# Altium project DA-12_MB.PrjPcb (part 1 of 4)
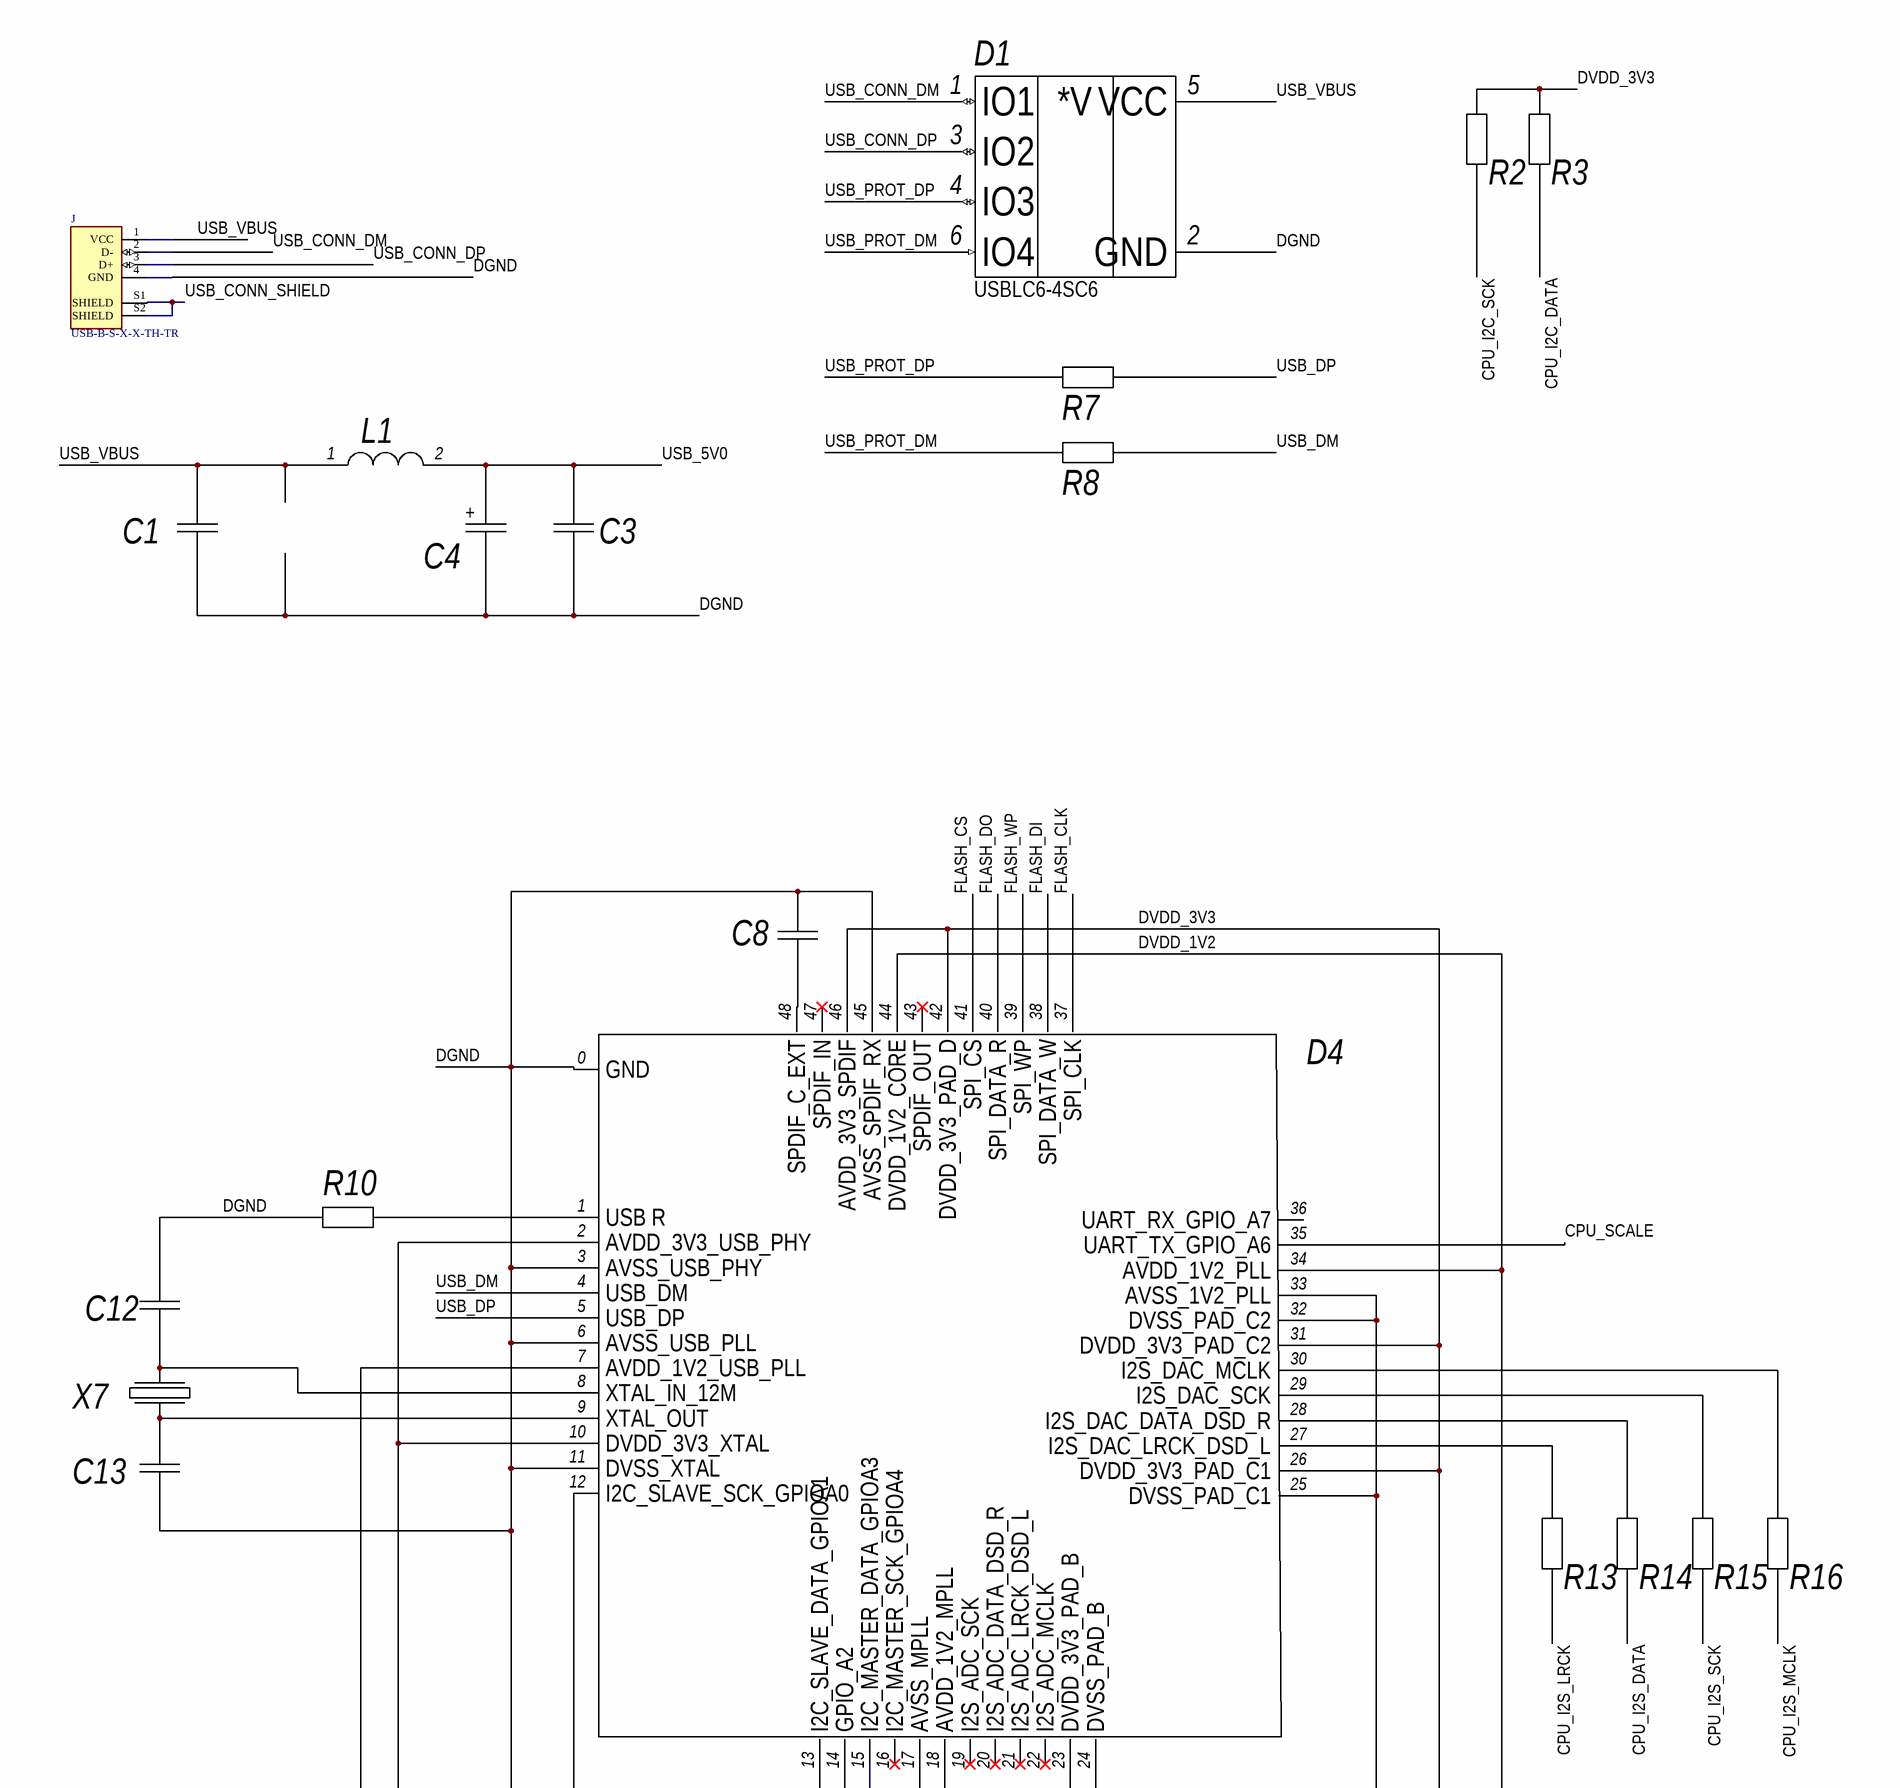
[diagram p0: da12-mb.SchDoc, top left]
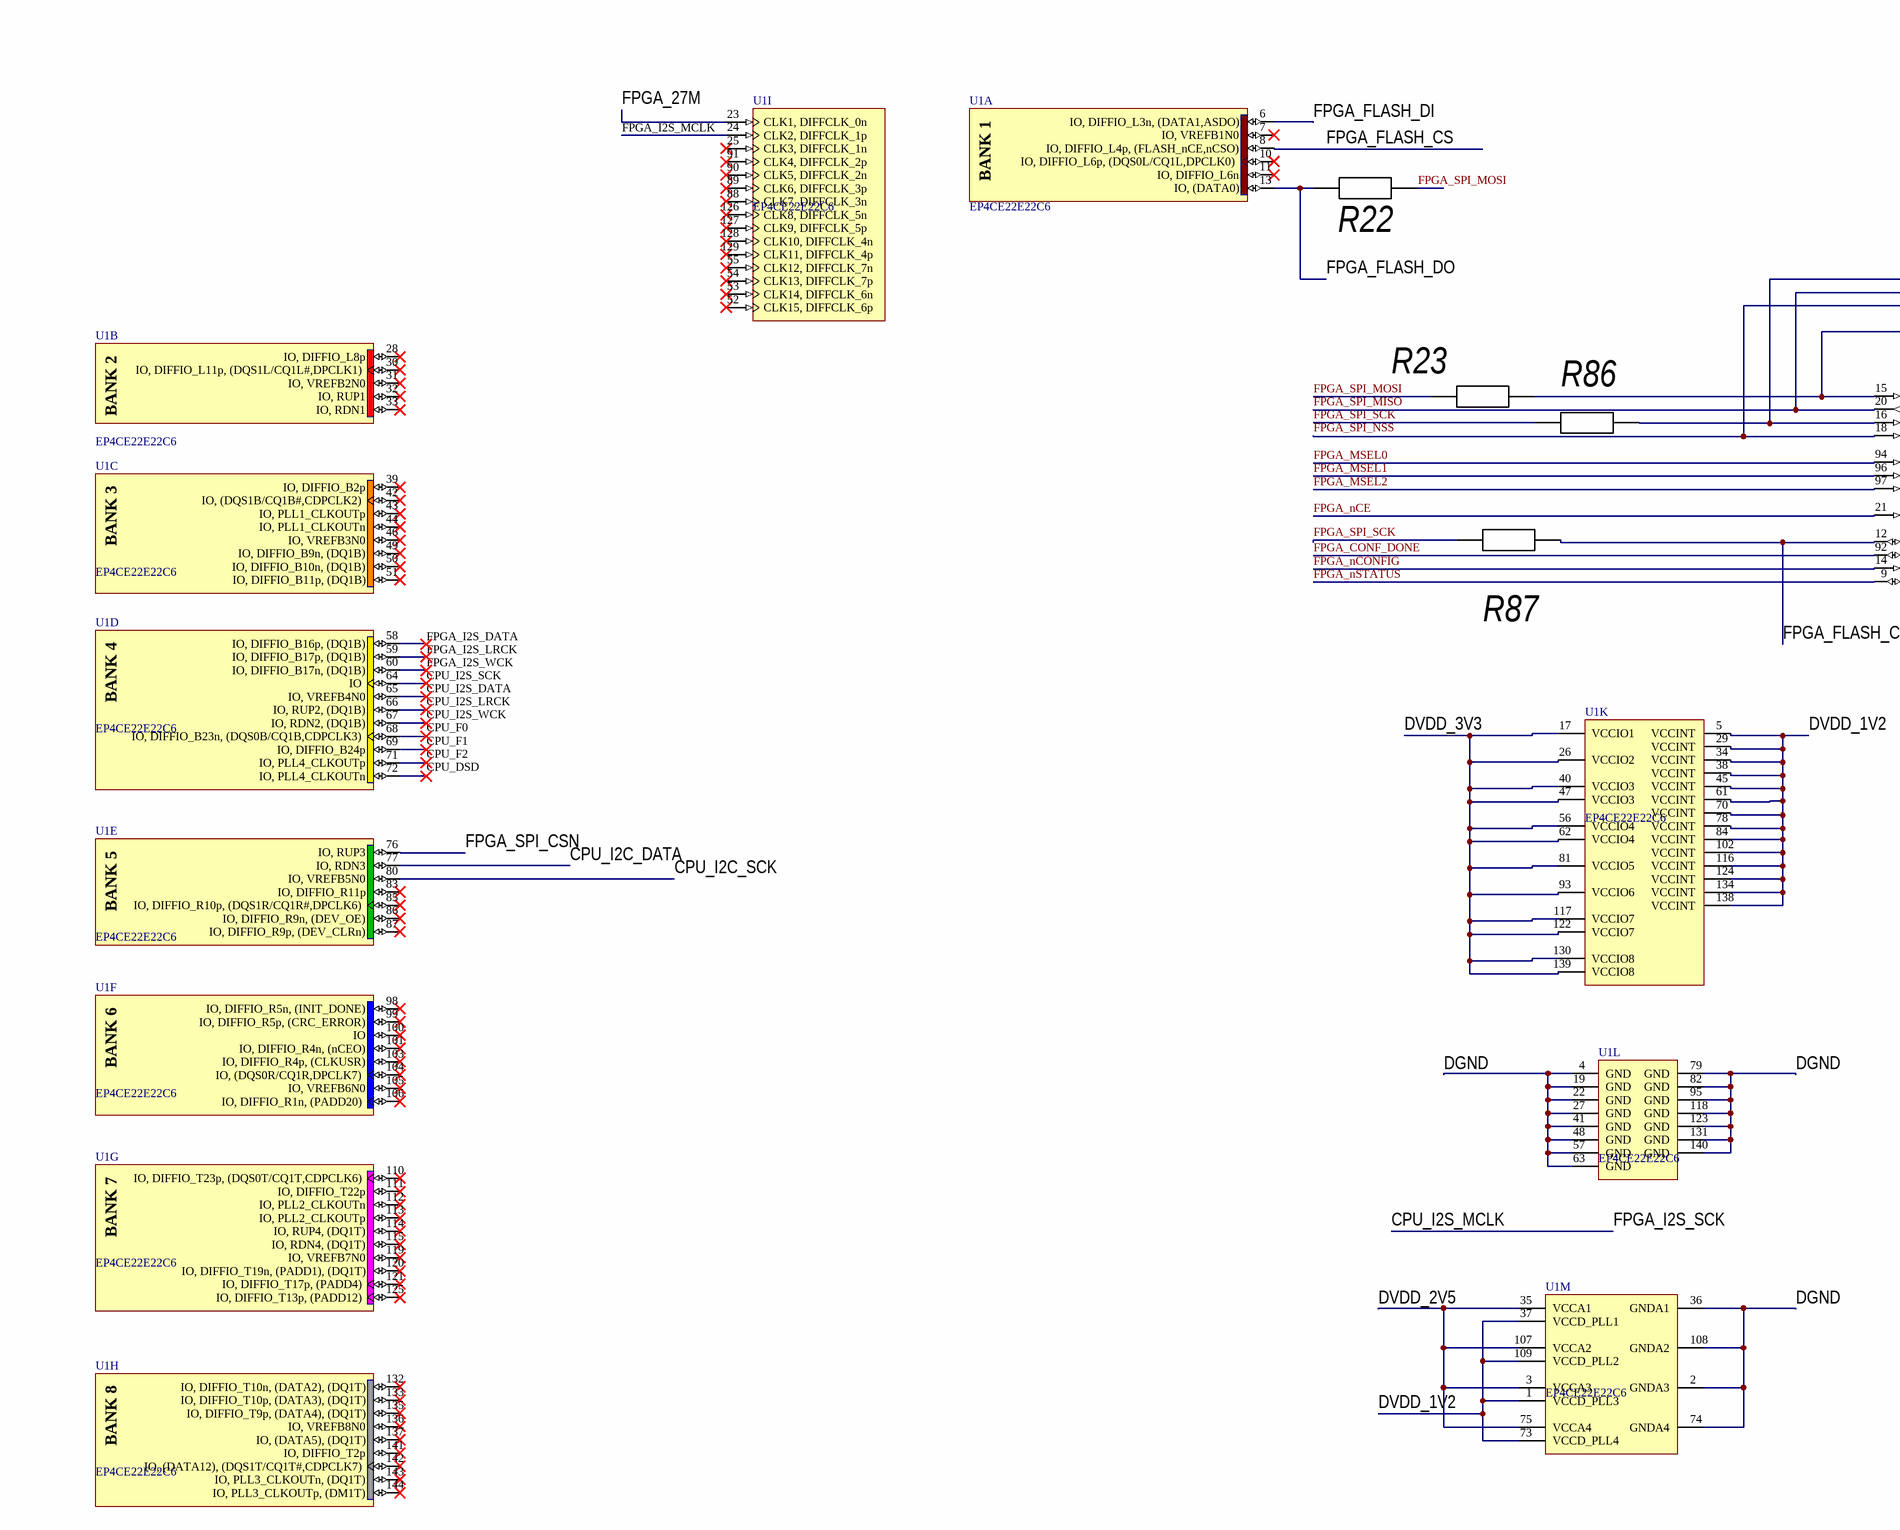
[diagram p1: da12-mb.SchDoc, top middle]
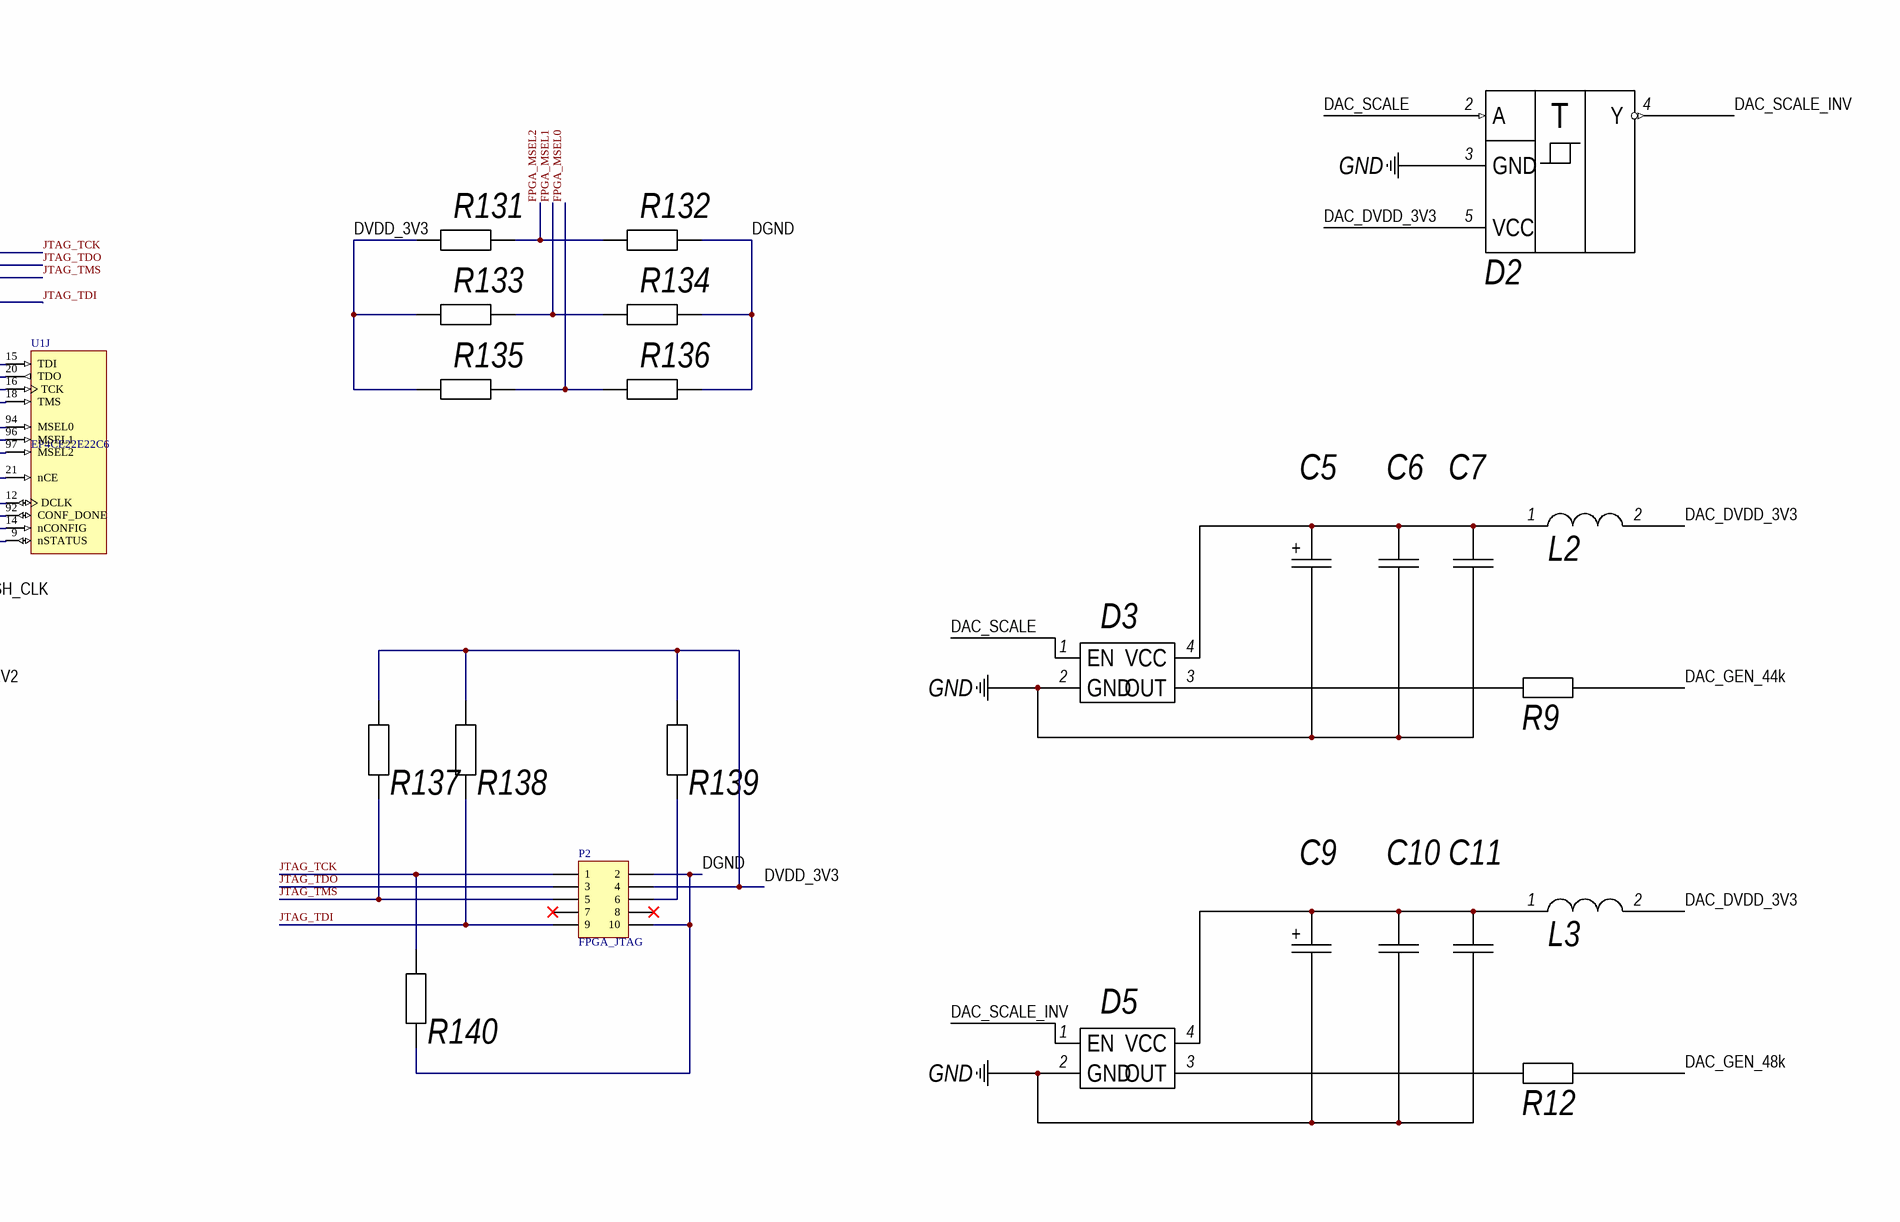
[diagram p2: da12-mb.SchDoc, top right]
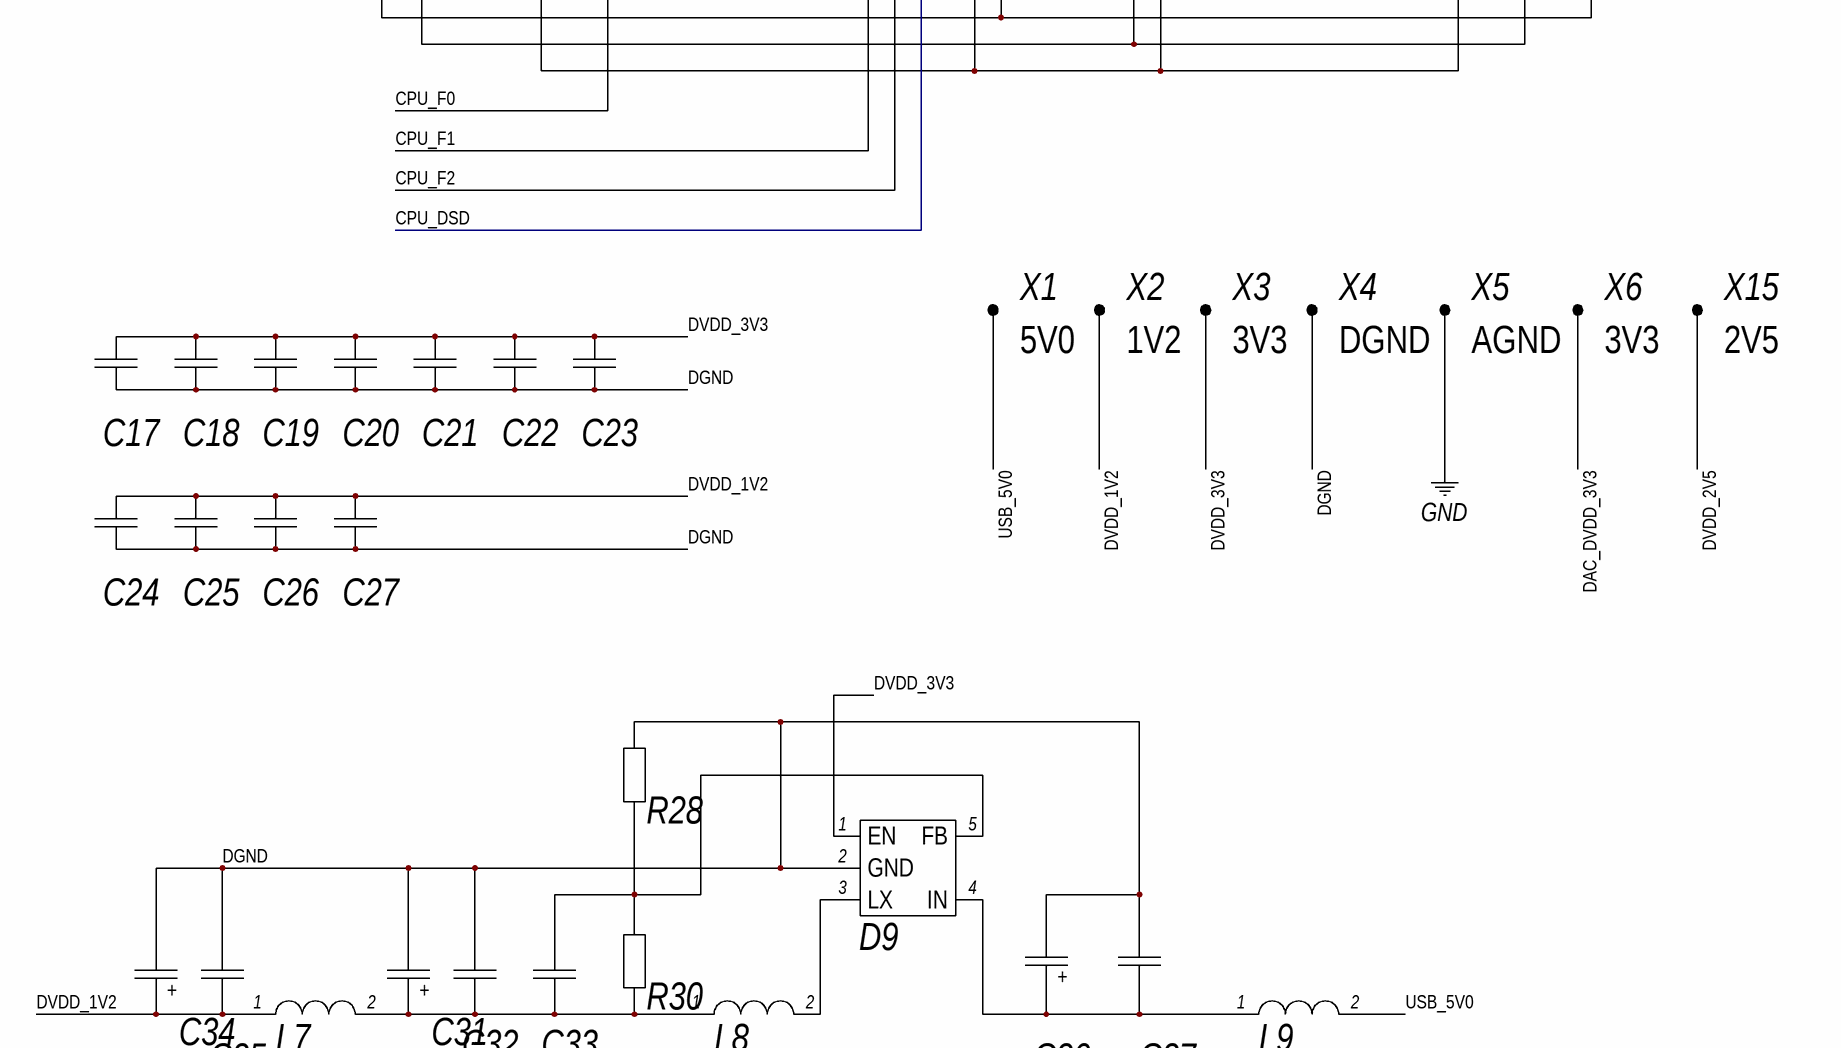
[diagram p3: da12-mb.SchDoc, centre left]
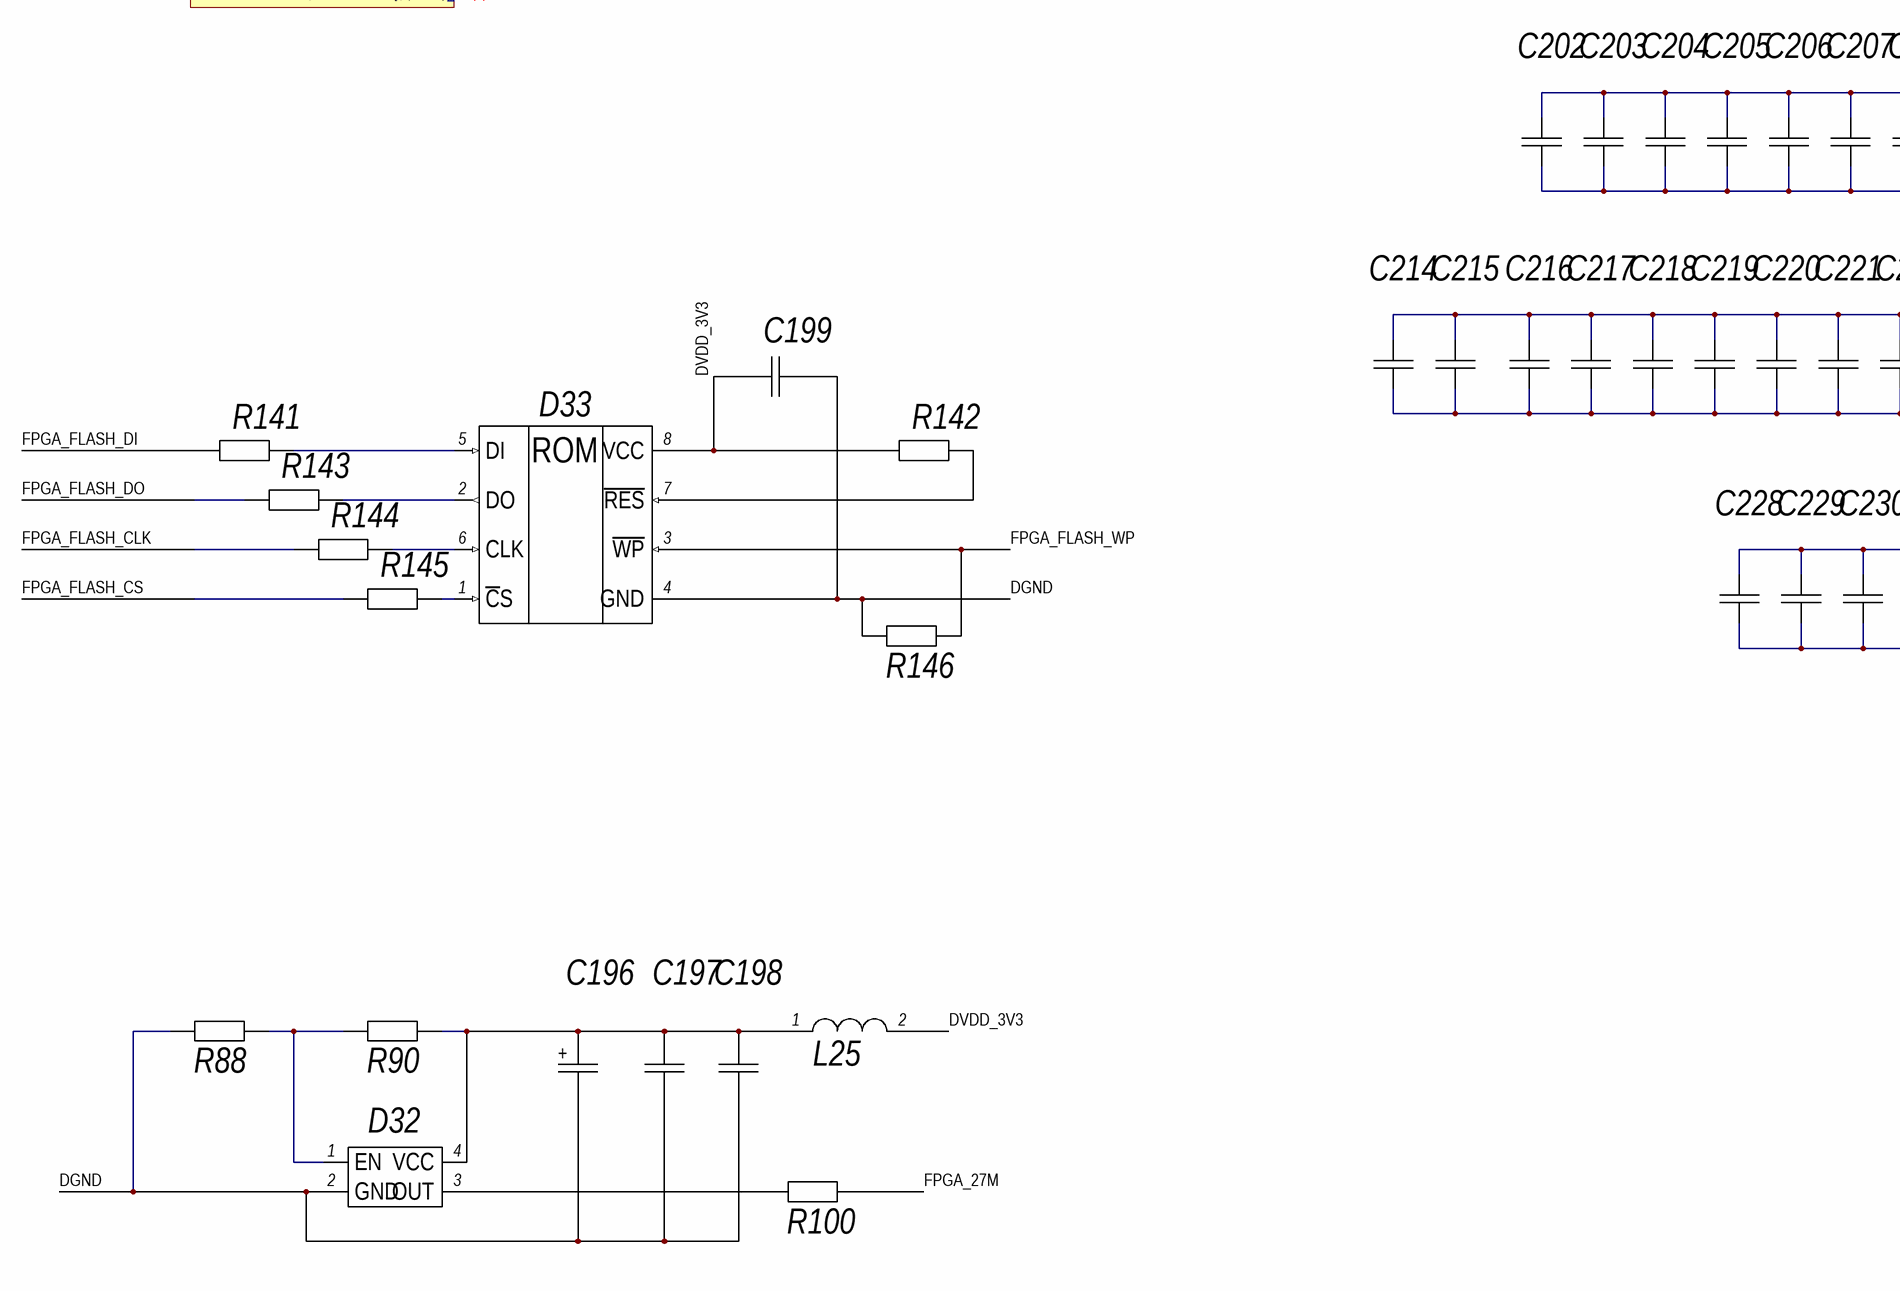
[diagram p4: da12-mb.SchDoc, centre middle]
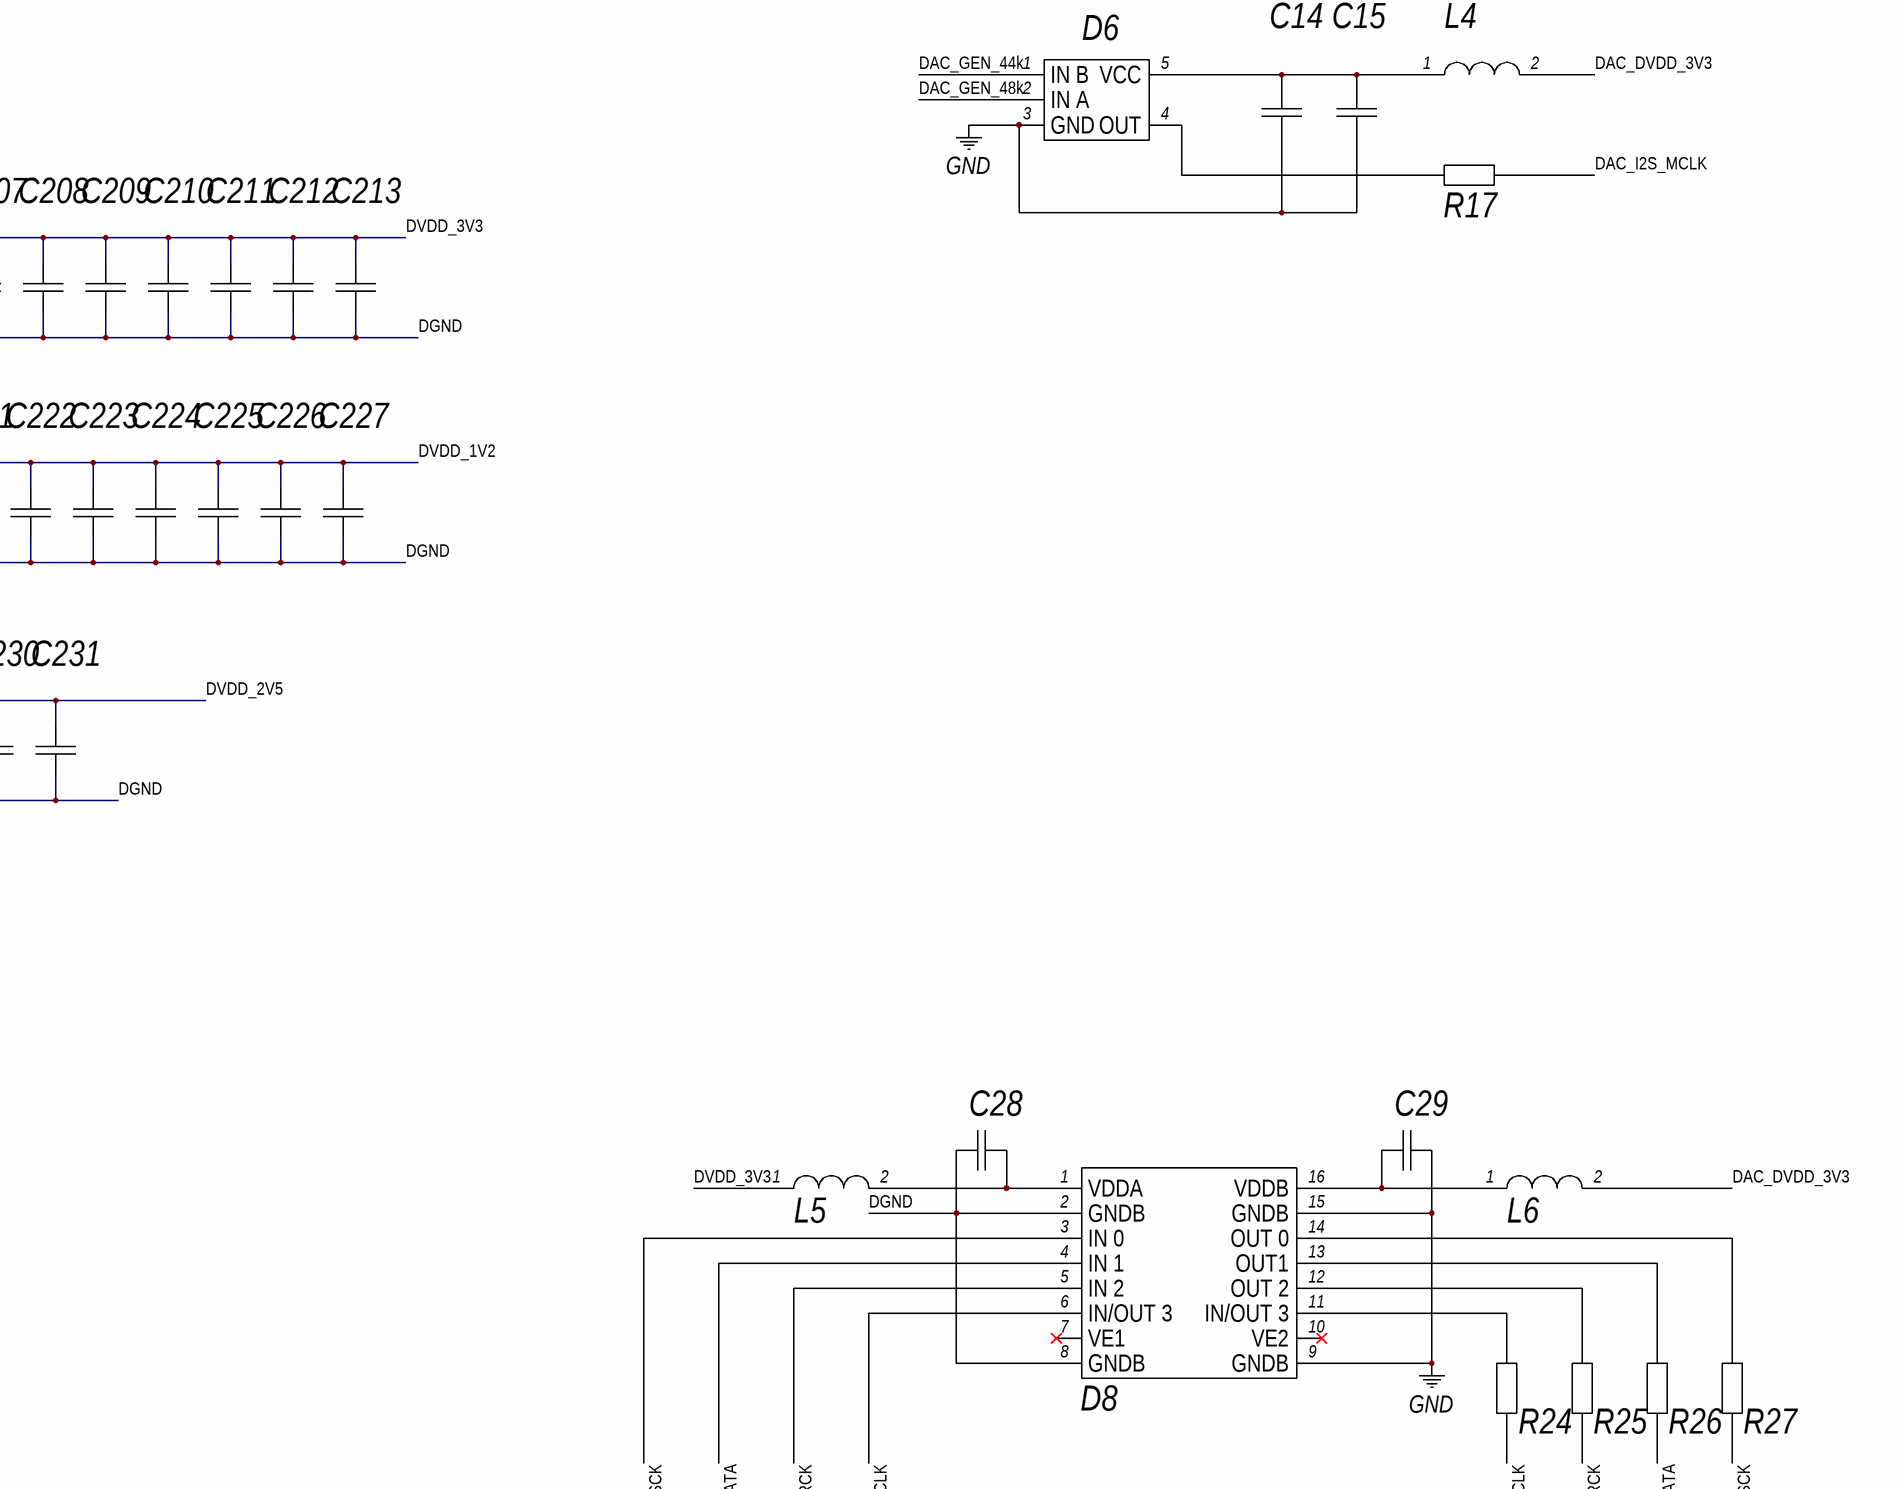
[diagram p5: da12-mb.SchDoc, centre right]
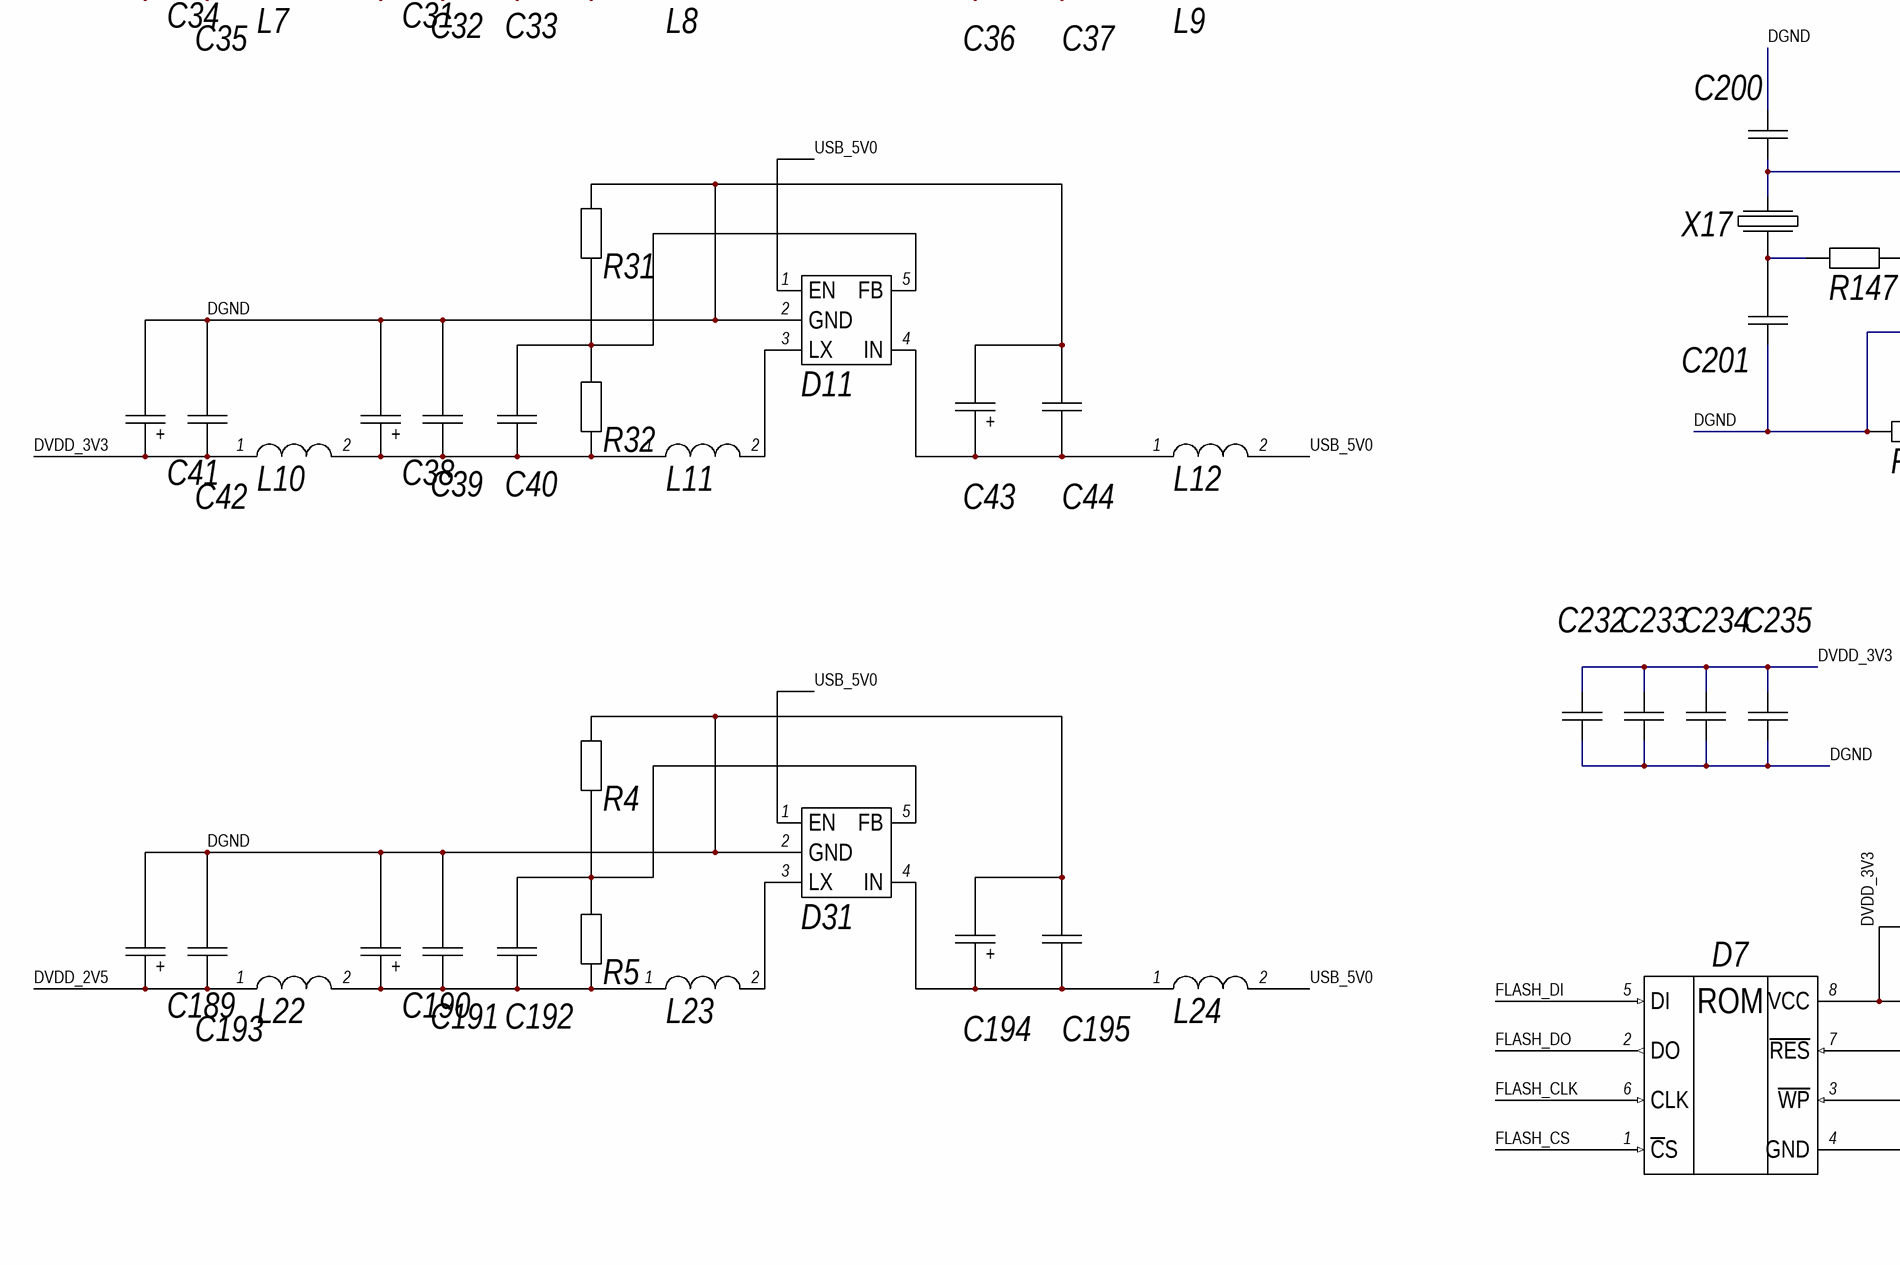
[diagram p6: da12-mb.SchDoc, bottom left]
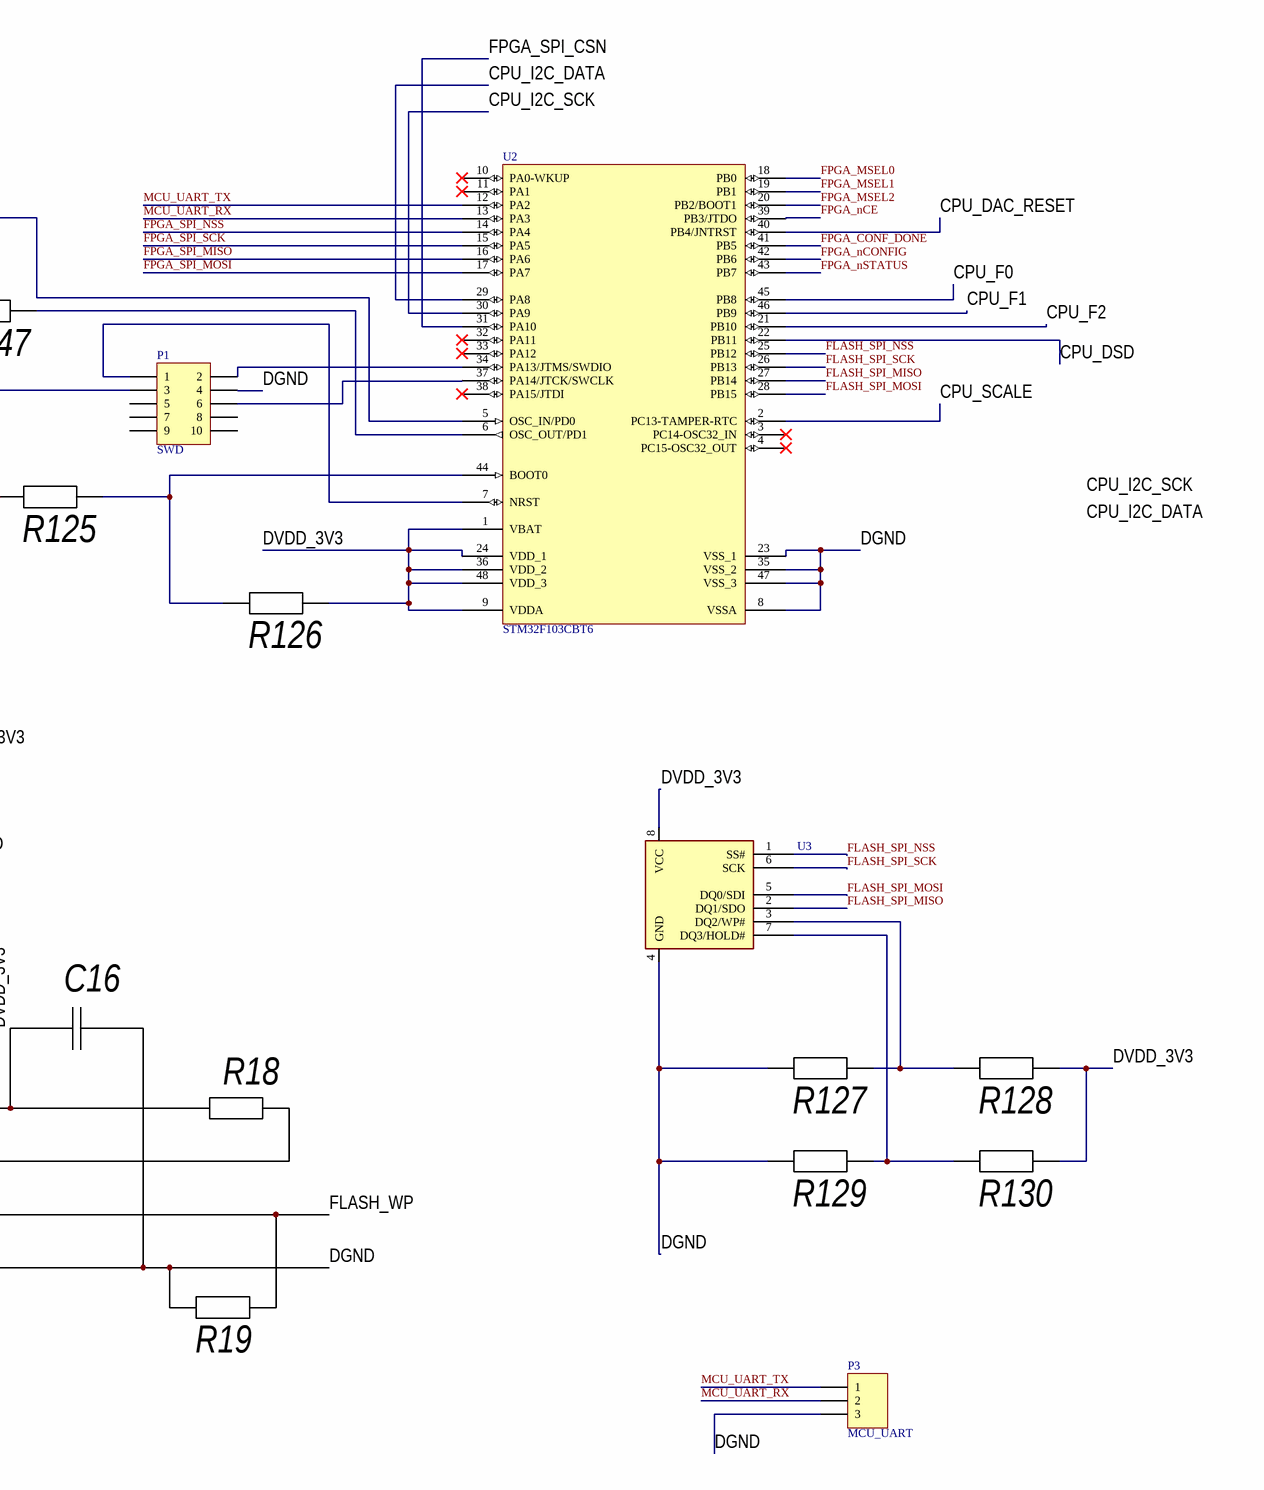
[diagram p7: da12-mb.SchDoc, bottom middle]
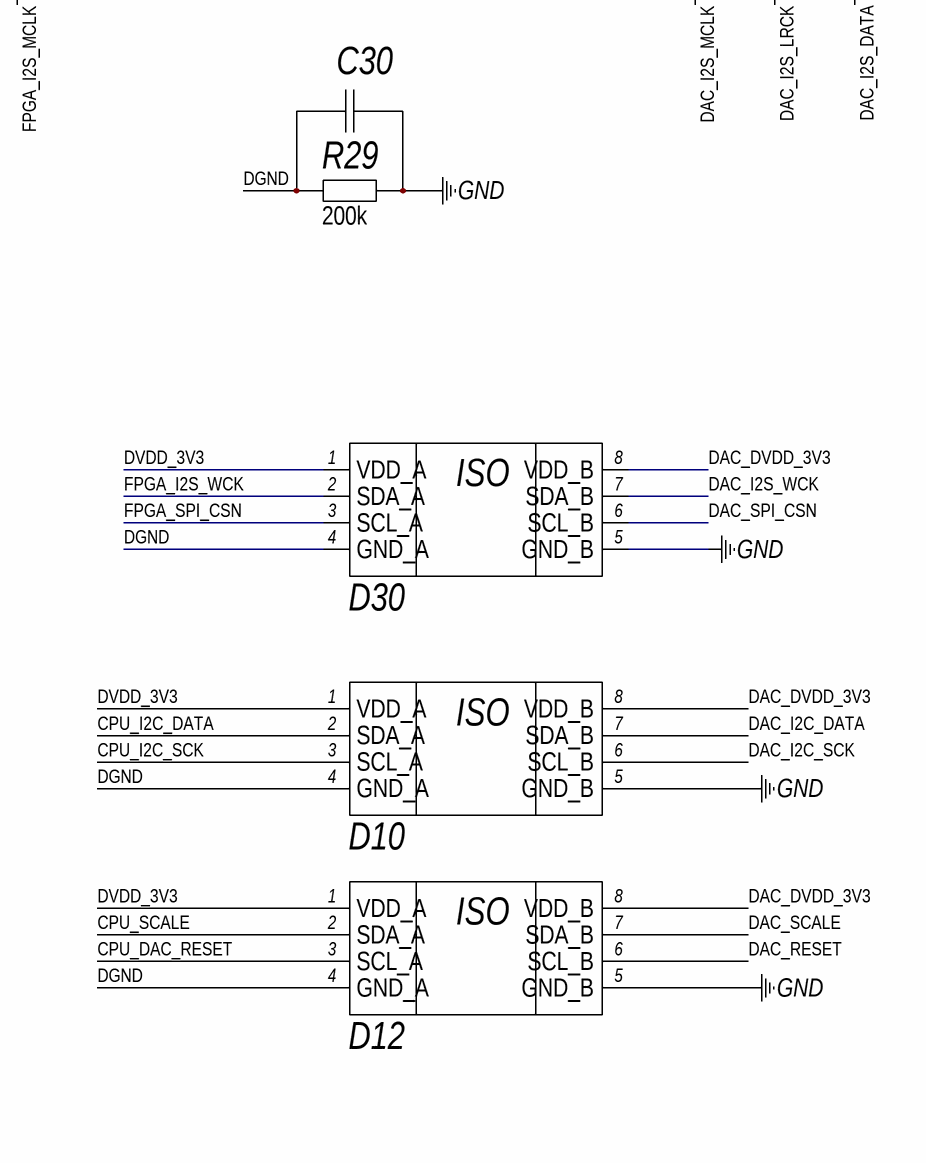
[diagram p8: da12-mb.SchDoc, bottom right]
3 sheets, 473 parts. Net scope: global (net labels, ports and power ports of the same name join across sheets).
Board files: da12_v100.PcbDoc, DA13_FPGA_edition.PcbDoc
Sheets:
  da12-mb.SchDoc
  DAC_4493.SchDoc
  ha.SchDoc

## Sheet da12-mb.SchDoc
size 1188 x 840 mm; SheetNumber: 1; SheetTotal: 3

### Parts
C1  CC0805MRX7R9BB104  [CAPC200X125X95L50N]  (value not drawn)
C3  CC0805MRX7R9BB104  [CAPC200X125X95L50N]  (value not drawn)
C4  EEEFK1A102AP  [CAPAE1030X1050L320X90N]  (value not drawn)
C5  Обозначение при заказе  [TANT_B]  (value not drawn)
C6  CC0805JRNPO9BN160  [CAPC200X125X95L50N]  (value not drawn)
C7  CC0805MRX7R9BB104  [CAPC200X125X95L50N]  (value not drawn)
C8  CC0805MRX7R9BB104  [CAPC200X125X95L50N]  (value not drawn)
C9  Обозначение при заказе  [TANT_B]  (value not drawn)
C10  CC0805JRNPO9BN160  [CAPC200X125X95L50N]  (value not drawn)
C11  CC0805MRX7R9BB104  [CAPC200X125X95L50N]  (value not drawn)
C12  CC0805JRNPO7BN220  [CAPC200X125X95L50N]  (value not drawn)
C13  CC0805JRNPO7BN220  [CAPC200X125X95L50N]  (value not drawn)
C14  CC0805JRNPO9BN160  [CAPC200X125X95L50N]  (value not drawn)
C15  CC0805MRX7R9BB104  [CAPC200X125X95L50N]  (value not drawn)
C16  CC0805MRX7R9BB104  [CAPC200X125X95L50N]  (value not drawn)
C17  CC0805MRX7R9BB104  [CAPC200X125X95L50N]  (value not drawn)
C18  CC0805MRX7R9BB104  [CAPC200X125X95L50N]  (value not drawn)
C19  CC0805MRX7R9BB104  [CAPC200X125X95L50N]  (value not drawn)
C20  CC0805MRX7R9BB104  [CAPC200X125X95L50N]  (value not drawn)
C21  CC0805MRX7R9BB104  [CAPC200X125X95L50N]  (value not drawn)
C22  CC0805MRX7R9BB104  [CAPC200X125X95L50N]  (value not drawn)
C23  CC0805MRX7R9BB104  [CAPC200X125X95L50N]  (value not drawn)
C24  CC0805MRX7R9BB104  [CAPC200X125X95L50N]  (value not drawn)
C25  CC0805MRX7R9BB104  [CAPC200X125X95L50N]  (value not drawn)
C26  CC0805MRX7R9BB104  [CAPC200X125X95L50N]  (value not drawn)
C27  CC0805MRX7R9BB104  [CAPC200X125X95L50N]  (value not drawn)
C28  CC0805MRX7R9BB104  [CAPC200X125X95L50N]  (value not drawn)
C29  CC0805MRX7R9BB104  [CAPC200X125X95L50N]  (value not drawn)
C30  GRM31CR71A226KE15L  [CAPC320X160X180L55]  (value not drawn)
C31  Обозначение при заказе  [TANT_B]  (value not drawn)
C32  CC0805MRX7R9BB104  [CAPC200X125X95L50N]  (value not drawn)
C33  CC0805MRX7R9BB101  [CAPC200X125X95L50N]  (value not drawn)
C34  Обозначение при заказе  [TANT_B]  (value not drawn)
C35  CC0805MRX7R9BB104  [CAPC200X125X95L50N]  (value not drawn)
C36  Обозначение при заказе  [TANT_B]  (value not drawn)
C37  CC0805MRX7R9BB104  [CAPC200X125X95L50N]  (value not drawn)
C38  Обозначение при заказе  [TANT_B]  (value not drawn)
C39  CC0805MRX7R9BB104  [CAPC200X125X95L50N]  (value not drawn)
C40  CC0805MRX7R9BB101  [CAPC200X125X95L50N]  (value not drawn)
C41  Обозначение при заказе  [TANT_B]  (value not drawn)
C42  CC0805MRX7R9BB104  [CAPC200X125X95L50N]  (value not drawn)
C43  Обозначение при заказе  [TANT_B]  (value not drawn)
C44  CC0805MRX7R9BB104  [CAPC200X125X95L50N]  (value not drawn)
C189  Обозначение при заказе  [TANT_B]  (value not drawn)
C190  Обозначение при заказе  [TANT_B]  (value not drawn)
C191  CC0805MRX7R9BB104  [CAPC200X125X95L50N]  (value not drawn)
C192  CC0805MRX7R9BB101  [CAPC200X125X95L50N]  (value not drawn)
C193  CC0805MRX7R9BB104  [CAPC200X125X95L50N]  (value not drawn)
C194  Обозначение при заказе  [TANT_B]  (value not drawn)
C195  CC0805MRX7R9BB104  [CAPC200X125X95L50N]  (value not drawn)
C196  Обозначение при заказе  [TANT_B]  (value not drawn)
C197  CC0805JRNPO9BN160  [CAPC200X125X95L50N]  (value not drawn)
C198  CC0805MRX7R9BB104  [CAPC200X125X95L50N]  (value not drawn)
C199  CC0805MRX7R9BB104  [CAPC200X125X95L50N]  (value not drawn)
C200  CC0805JRNPO7BN220  [CAPC200X125X95L50N]  (value not drawn)
C201  CC0805JRNPO7BN220  [CAPC200X125X95L50N]  (value not drawn)
C202  CC0805MRX7R9BB104  [CAPC200X125X95L50N]  (value not drawn)
C203  CC0805MRX7R9BB104  [CAPC200X125X95L50N]  (value not drawn)
C204  CC0805MRX7R9BB104  [CAPC200X125X95L50N]  (value not drawn)
C205  CC0805MRX7R9BB104  [CAPC200X125X95L50N]  (value not drawn)
C206  CC0805MRX7R9BB104  [CAPC200X125X95L50N]  (value not drawn)
C207  CC0805MRX7R9BB104  [CAPC200X125X95L50N]  (value not drawn)
C208  CC0805MRX7R9BB104  [CAPC200X125X95L50N]  (value not drawn)
C209  CC0805MRX7R9BB104  [CAPC200X125X95L50N]  (value not drawn)
C210  CC0805MRX7R9BB104  [CAPC200X125X95L50N]  (value not drawn)
C211  CC0805MRX7R9BB104  [CAPC200X125X95L50N]  (value not drawn)
C212  CC0805MRX7R9BB104  [CAPC200X125X95L50N]  (value not drawn)
C213  CC0805MRX7R9BB104  [CAPC200X125X95L50N]  (value not drawn)
C214  CC0805MRX7R9BB104  [CAPC200X125X95L50N]  (value not drawn)
C215  CC0805MRX7R9BB104  [CAPC200X125X95L50N]  (value not drawn)
C216  CC0805MRX7R9BB104  [CAPC200X125X95L50N]  (value not drawn)
C217  CC0805MRX7R9BB104  [CAPC200X125X95L50N]  (value not drawn)
C218  CC0805MRX7R9BB104  [CAPC200X125X95L50N]  (value not drawn)
C219  CC0805MRX7R9BB104  [CAPC200X125X95L50N]  (value not drawn)
C220  CC0805MRX7R9BB104  [CAPC200X125X95L50N]  (value not drawn)
C221  CC0805MRX7R9BB104  [CAPC200X125X95L50N]  (value not drawn)
C222  CC0805MRX7R9BB104  [CAPC200X125X95L50N]  (value not drawn)
C223  CC0805MRX7R9BB104  [CAPC200X125X95L50N]  (value not drawn)
C224  CC0805MRX7R9BB104  [CAPC200X125X95L50N]  (value not drawn)
C225  CC0805MRX7R9BB104  [CAPC200X125X95L50N]  (value not drawn)
C226  CC0805MRX7R9BB104  [CAPC200X125X95L50N]  (value not drawn)
C227  CC0805MRX7R9BB104  [CAPC200X125X95L50N]  (value not drawn)
C228  CC0805MRX7R9BB104  [CAPC200X125X95L50N]  (value not drawn)
C229  CC0805MRX7R9BB104  [CAPC200X125X95L50N]  (value not drawn)
C230  CC0805MRX7R9BB104  [CAPC200X125X95L50N]  (value not drawn)
C231  CC0805MRX7R9BB104  [CAPC200X125X95L50N]  (value not drawn)
C232  CC0805MRX7R9BB104  [CAPC200X125X95L50N]  (value not drawn)
C233  CC0805MRX7R9BB104  [CAPC200X125X95L50N]  (value not drawn)
C234  CC0805MRX7R9BB104  [CAPC200X125X95L50N]  (value not drawn)
C235  CC0805MRX7R9BB104  [CAPC200X125X95L50N]  (value not drawn)
D1  USBLC6-4SC6  [SOT23-6P95_280X145L45X40N]
D2  SN74LVC1G14DBVR  [SOT23-5P95_280X145L45X40N]  (value not drawn)
D3  Обозначение при заказе  [DIL4]  (value not drawn)
D4  Обозначение при заказе  [48-QFN (6x6)]  (value not drawn)
D5  Обозначение при заказе  [DIL4]  (value not drawn)
D6  Обозначение при заказе  [SOT23-5P95_280X145L45X40N]  (value not drawn)
D7  W25Q32JVSS  [SOIC8P127_528X790X100L65X41N]  (value not drawn)
D8  Обозначение при заказе  [adum1400]  (value not drawn)
D9  Обозначение при заказе  [SOT23-5P95_280X145L45X40N]  (value not drawn)
D10  Обозначение при заказе  [SOIC8P127_490X600X175L65X42N]  (value not drawn)
D11  Обозначение при заказе  [SOT23-5P95_280X145L45X40N]  (value not drawn)
D12  Обозначение при заказе  [SOIC8P127_490X600X175L65X42N]  (value not drawn)
D30  Обозначение при заказе  [SOIC8P127_490X600X175L65X42N]  (value not drawn)
D31  Обозначение при заказе  [SOT23-5P95_280X145L45X40N]  (value not drawn)
D32  Обозначение при заказе  [DIL4]  (value not drawn)
D33  W25Q32JVSS  [SOIC8P127_528X790X100L65X41N]  (value not drawn)
J  USB-B-S-X-X-TH-TR  [SAMTEC_USB-B-S-X-X-TH-TR]
L1  Обозначение при заказе  [RESC200X125X60L35]  (value not drawn)
L2  Обозначение при заказе  [RESC200X125X60L35]  (value not drawn)
L3  Обозначение при заказе  [RESC200X125X60L35]  (value not drawn)
L4  Обозначение при заказе  [RESC200X125X60L35]  (value not drawn)
L5  Обозначение при заказе  [RESC200X125X60L35]  (value not drawn)
L6  Обозначение при заказе  [RESC200X125X60L35]  (value not drawn)
L7  LQH2MCN220K02L  [INDM320X250X220L90X200N]  (value not drawn)
L8  LQH2MCN220K02L  [INDM320X250X220L90X200N]  (value not drawn)
L9  Обозначение при заказе  [RESC200X125X60L35]  (value not drawn)
L10  LQH2MCN220K02L  [INDM320X250X220L90X200N]  (value not drawn)
L11  LQH2MCN220K02L  [INDM320X250X220L90X200N]  (value not drawn)
L12  Обозначение при заказе  [RESC200X125X60L35]  (value not drawn)
L22  LQH2MCN220K02L  [INDM320X250X220L90X200N]  (value not drawn)
L23  LQH2MCN220K02L  [INDM320X250X220L90X200N]  (value not drawn)
L24  Обозначение при заказе  [RESC200X125X60L35]  (value not drawn)
L25  Обозначение при заказе  [RESC200X125X60L35]  (value not drawn)
P1  SWD  [HDR2X5]
P2  FPGA_JTAG  [HDR2X5]
P3  MCU_UART  [HDR1X3]
R2  RC0805JR-0710KL  [RESC200X125X60L35]  (value not drawn)
R3  RC0805JR-0710KL  [RESC200X125X60L35]  (value not drawn)
R4  RC0805JR-0710KL  [RESC200X125X60L35]  (value not drawn)
R5  RC0805JR-0710KL  [RESC200X125X60L35]  (value not drawn)
R7  RC0805JR-0724RL  [RESC200X125X60L35]  (value not drawn)
R8  RC0805JR-0724RL  [RESC200X125X60L35]  (value not drawn)
R9  RC0805JR-0710RL  [RESC200X125X60L35]  (value not drawn)
R10  RC0805JR-0718RL  [RESC200X125X60L35]  (value not drawn)
R12  RC0805JR-0710RL  [RESC200X125X60L35]  (value not drawn)
R13  RC0805JR-0710RL  [RESC200X125X60L35]  (value not drawn)
R14  RC0805JR-0710RL  [RESC200X125X60L35]  (value not drawn)
R15  RC0805JR-0710RL  [RESC200X125X60L35]  (value not drawn)
R16  RC0805JR-0710RL  [RESC200X125X60L35]  (value not drawn)
R17  RC0805JR-0710RL  [RESC200X125X60L35]  (value not drawn)
R18  RC0805JR-07100KL  [RESC200X125X60L35]  (value not drawn)
R19  RC0805JR-07100KL  [RESC200X125X60L35]  (value not drawn)
R22  RC0805JR-0710RL  [RESC200X125X60L35]  (value not drawn)
R23  RC0805JR-0710RL  [RESC200X125X60L35]  (value not drawn)
R24  RC0805JR-0710RL  [RESC200X125X60L35]  (value not drawn)
R25  RC0805JR-0710RL  [RESC200X125X60L35]  (value not drawn)
R26  RC0805JR-0710RL  [RESC200X125X60L35]  (value not drawn)
R27  RC0805JR-0710RL  [RESC200X125X60L35]  (value not drawn)
R28  RC0805JR-0710KL  [RESC200X125X60L35]  (value not drawn)
R29  value 200k  [RESC310X160X65L40N]  (hidden comment: RC1206JR-07200KL)
R30  RC0805JR-0710KL  [RESC200X125X60L35]  (value not drawn)
R31  RC0805JR-0710KL  [RESC200X125X60L35]  (value not drawn)
R32  RC0805JR-0710KL  [RESC200X125X60L35]  (value not drawn)
R86  RC0805JR-0710RL  [RESC200X125X60L35]  (value not drawn)
R87  RC0805JR-0710RL  [RESC200X125X60L35]  (value not drawn)
R88  RC0805JR-0710RL  [RESC200X125X60L35]  (value not drawn)
R90  RC0805JR-0710RL  [RESC200X125X60L35]  (value not drawn)
R100  RC0805JR-0710RL  [RESC200X125X60L35]  (value not drawn)
R125  RC0805JR-0710RL  [RESC200X125X60L35]  (value not drawn)
R126  RC0805JR-0710RL  [RESC200X125X60L35]  (value not drawn)
R127  RC0805JR-0710RL  [RESC200X125X60L35]  (value not drawn)
R128  RC0805JR-0710RL  [RESC200X125X60L35]  (value not drawn)
R129  RC0805JR-0710RL  [RESC200X125X60L35]  (value not drawn)
R130  RC0805JR-0710RL  [RESC200X125X60L35]  (value not drawn)
R131  RC0805JR-07100KL  [RESC200X125X60L35]  (value not drawn)
R132  RC0805JR-07100KL  [RESC200X125X60L35]  (value not drawn)
R133  RC0805JR-07100KL  [RESC200X125X60L35]  (value not drawn)
R134  RC0805JR-07100KL  [RESC200X125X60L35]  (value not drawn)
R135  RC0805JR-07100KL  [RESC200X125X60L35]  (value not drawn)
R136  RC0805JR-07100KL  [RESC200X125X60L35]  (value not drawn)
R137  RC0805JR-0710RL  [RESC200X125X60L35]  (value not drawn)
R138  RC0805JR-0710RL  [RESC200X125X60L35]  (value not drawn)
R139  RC0805JR-0710RL  [RESC200X125X60L35]  (value not drawn)
R140  RC0805JR-0710RL  [RESC200X125X60L35]  (value not drawn)
R141  RC0805JR-07100KL  [RESC200X125X60L35]  (value not drawn)
R142  RC0805JR-07100KL  [RESC200X125X60L35]  (value not drawn)
R143  RC0805JR-07100KL  [RESC200X125X60L35]  (value not drawn)
R144  RC0805JR-07100KL  [RESC200X125X60L35]  (value not drawn)
R145  RC0805JR-07100KL  [RESC200X125X60L35]  (value not drawn)
R146  RC0805JR-07100KL  [RESC200X125X60L35]  (value not drawn)
R147  RC0805JR-0710RL  [RESC200X125X60L35]  (value not drawn)
U1  EP4CE22E22C6  [EQFP144_N]  (parts A,B,C,D,E,F,G,H,I,J,K,L,M of 13)
U2  STM32F103CBT6  [LQFP48_N]
U3  W25Q  [SO_8_W]  (value not drawn)
X1  Marck-2: 5V0  [C_P]  (hidden comment: C_P)  (no BOM)
X2  Marck-2: 1V2  [C_P]  (hidden comment: C_P)  (no BOM)
X3  Marck-2: 3V3  [C_P]  (hidden comment: C_P)  (no BOM)
X4  Marck-2: DGND  [C_P]  (hidden comment: C_P)  (no BOM)
X5  Marck-2: AGND  [C_P]  (hidden comment: C_P)  (no BOM)
X6  Marck-2: 3V3  [C_P]  (hidden comment: C_P)  (no BOM)
X7  Обозначение при заказе  [HC-49]  (value not drawn)
X15  Marck-2: 2V5  [C_P]  (hidden comment: C_P)  (no BOM)
X17  Обозначение при заказе  [HC-49]  (value not drawn)

### Nets
GND: C5.2 C6.2 C7.2 C9.2 C10.2 C11.2 C14.2 C15.2 C29.2 C30.2 D2.3(GND) D3.2(GND) D5.2(GND) D6.3(GND) D8.9(GNDB) D8.15(GNDB) D10.5(GND_B) D12.5(GND_B) D30.5(GND_B) R29.2 X5.1
CPU_DAC_RESET: D12.3(SCL_A) U2.40(PB4/JNTRST)
CPU_DSD: D4.15(I2C_MASTER_DATA_GPIOA3) U1.72(IO,_PLL4_CLKOUTn) U2.22(PB11)
CPU_F0: D4.12(I2C_SLAVE_SCK_GPIOA0) U1.68(IO,_DIFFIO_B23n,_(DQS0B/CQ1B,CDPCLK3)) U2.45(PB8)
CPU_F1: D4.13(I2C_SLAVE_DATA_GPIOA1) U1.69(IO,_DIFFIO_B24p) U2.46(PB9)
CPU_F2: D4.14(GPIO_A2) U1.71(IO,_PLL4_CLKOUTp) U2.21(PB10)
CPU_I2C_DATA: D10.2(SDA_A) R3.1 U1.77(IO,_RDN3) U2.29(PA8)
CPU_I2C_SCK: D10.3(SCL_A) R2.1 U1.80(IO,_VREFB5N0) U2.30(PA9)
CPU_I2S_DATA: R14.1 U1.65(IO,_VREFB4N0)
CPU_I2S_LRCK: R13.1 U1.66(IO,_RUP2,_(DQ1B))
CPU_I2S_MCLK: D8.3(IN_0) R16.1  [also labelled FPGA_I2S_SCK]
CPU_I2S_SCK: R15.1 U1.64(IO)
CPU_I2S_WCK: U1.67(IO,_RDN2,_(DQ1B))
CPU_SCALE: D4.35(UART_TX_GPIO_A6) D12.2(SDA_A) U2.2(PC13-TAMPER-RTC)
DAC_DVDD_3V3: D2.5(VCC) D10.8(VDD_B) D12.8(VDD_B) D30.8(VDD_B) L2.2 L3.2 L4.2 L6.2 X6.1
DAC_GEN_44k: D6.1(IN_B) R9.2
DAC_GEN_48k: D6.2(IN_A) R12.2
DAC_I2C_DATA: D10.7(SDA_B)
DAC_I2C_SCK: D10.6(SCL_B)
DAC_I2S_DATA: R26.1
DAC_I2S_LRCK: R25.1
DAC_I2S_MCLK: R17.2 R24.1
DAC_I2S_SCK: R27.1
DAC_I2S_WCK: D30.7(SDA_B)
DAC_RESET: D12.6(SCL_B)
DAC_SCALE: D2.2(A) D3.1(EN) D12.7(SDA_B)
DAC_SCALE_INV: D2.4(Y) D5.1(EN)
DAC_SPI_CSN: D30.6(SCL_B)
DGND: C1.2 C3.2 C4.2 C8.1 C12.2 C13.1 C16.2 C17.2 C18.2 C19.2 C20.2 C21.2 C22.2 C23.2 C24.2 C25.2 C26.2 C27.2 C28.1 C30.1 C31.2 C32.1 C34.2 C35.1 C36.2 C37.1 C38.2 C39.1 C41.2 C42.1 C43.2 C44.1 C189.2 C190.2 C191.1 C193.1 C194.2 C195.1 C196.2 C197.2 C198.2 C199.2 C200.2 C201.1 C202.2 C203.2 C204.2 C205.2 C206.2 C207.2 C208.2 C209.2 C210.2 C211.2 C212.2 C213.2 C214.2 C215.2 C216.2 C217.2 C218.2 C219.2 C220.2 C221.2 C222.2 C223.2 C224.2 C225.2 C226.2 C227.2 C228.2 C229.2 C230.2 C231.2 C232.2 C233.2 C234.2 C235.2 D1.2(GND) D4.0(GND) D4.3(AVSS_USB_PHY) D4.6(AVSS_USB_PLL) D4.11(DVSS_XTAL) D4.17(AVSS_MPLL) D4.24(DVSS_PAD_B) D4.25(DVSS_PAD_C1) D4.32(DVSS_PAD_C2) D4.33(AVSS_1V2_PLL) D4.45(AVSS_SPDIF_RX) D7.4(GND) D8.2(GNDB) D8.8(GNDB) D9.2(GND) D10.4(GND_A) D11.2(GND) D12.4(GND_A) D30.4(GND_A) D31.2(GND) D32.2(GND) D33.4(GND) J.4(GND) P1.3 P1.4 P2.2 P2.10 P3.3 R4.2 R10.1 R19.2 R28.2 R29.1 R31.2 R88.1 R125.1 R127.1 R129.1 R132.2 R134.2 R136.2 R140.1 R146.2 U1.2(GNDA3) U1.4(GND) U1.19(GND) U1.22(GND) U1.27(GND) U1.36(GNDA1) U1.41(GND) U1.48(GND) U1.57(GND) U1.63(GND) U1.74(GNDA4) U1.79(GND) U1.82(GND) U1.95(GND) U1.108(GNDA2) U1.118(GND) U1.123(GND) U1.131(GND) U1.140(GND) U2.8(VSSA) U2.23(VSS_1) U2.35(VSS_2) U2.47(VSS_3) U3.4(GND) X4.1
DVDD_1V2: C24.1 C25.1 C26.1 C27.1 C34.1 C35.2 C214.1 C215.1 C216.1 C217.1 C218.1 C219.1 C220.1 C221.1 C222.1 C223.1 C224.1 C225.1 C226.1 C227.1 D4.7(AVDD_1V2_USB_PLL) D4.18(AVDD_1V2_MPLL) D4.34(AVDD_1V2_PLL) D4.44(DVDD_1V2_CORE) L7.1 U1.1(VCCD_PLL3) U1.5(VCCINT) U1.29(VCCINT) U1.34(VCCINT) U1.37(VCCD_PLL1) U1.38(VCCINT) U1.45(VCCINT) U1.61(VCCINT) U1.70(VCCINT) U1.73(VCCD_PLL4) U1.78(VCCINT) U1.84(VCCINT) U1.102(VCCINT) U1.109(VCCD_PLL2) U1.116(VCCINT) U1.124(VCCINT) U1.134(VCCINT) U1.138(VCCINT) X2.1
DVDD_2V5: C189.1 C193.2 C228.1 C229.1 C230.1 C231.1 L22.1 U1.3(VCCA3) U1.35(VCCA1) U1.75(VCCA4) U1.107(VCCA2) X15.1
DVDD_3V3: C16.1 C17.1 C18.1 C19.1 C20.1 C21.1 C22.1 C23.1 C41.1 C42.2 C199.1 C202.1 C203.1 C204.1 C205.1 C206.1 C207.1 C208.1 C209.1 C210.1 C211.1 C212.1 C213.1 C232.1 C233.1 C234.1 C235.1 D4.2(AVDD_3V3_USB_PHY) D4.10(DVDD_3V3_XTAL) D4.23(DVDD_3V3_PAD_B) D4.26(DVDD_3V3_PAD_C1) D4.31(DVDD_3V3_PAD_C2) D4.42(DVDD_3V3_PAD_D) D4.46(AVDD_3V3_SPDIF) D7.8(VCC) D9.1(EN) D10.1(VDD_A) D12.1(VDD_A) D30.1(VDD_A) D33.8(VCC) L5.1 L10.1 L25.2 P2.4 R2.2 R3.2 R18.1 R126.2 R128.2 R130.2 R131.1 R133.1 R135.1 R137.2 R138.2 R139.2 R142.1 U1.17(VCCIO1) U1.26(VCCIO2) U1.40(VCCIO3) U1.47(VCCIO3) U1.56(VCCIO4) U1.62(VCCIO4) U1.81(VCCIO5) U1.93(VCCIO6) U1.117(VCCIO7) U1.122(VCCIO7) U1.130(VCCIO8) U1.139(VCCIO8) U2.1(VBAT) U2.9(VDDA) U2.24(VDD_1) U2.36(VDD_2) U2.48(VDD_3) U3.8(VCC) X3.1
FLASH_CLK: D4.37(SPI_CLK) D7.6(CLK)
FLASH_CS: D4.41(SPI_CS) D7.1(~{C}S)
FLASH_DI: D4.38(SPI_DATA_W) D7.5(DI)
FLASH_DO: D4.40(SPI_DATA_R) D7.2(DO)
FLASH_SPI_MISO: U2.27(PB14) U3.2(DQ1/SDO)
FLASH_SPI_MOSI: U2.28(PB15) U3.5(DQ0/SDI)
FLASH_SPI_NSS: U2.25(PB12) U3.1(SS#)
FLASH_SPI_SCK: U2.26(PB13) U3.6(SCK)
FLASH_WP: D4.39(SPI_WP) D7.3(~{WP}) R19.1
FPGA_27M: R100.2 U1.23(CLK1,_DIFFCLK_0n)
FPGA_CONF_DONE: U1.92(CONF_DONE) U2.41(PB5)
FPGA_FLASH_CLK: R87.2 R144.1 U1.12(DCLK)
FPGA_FLASH_CS: R145.1 U1.8(IO,_DIFFIO_L4p,_(FLASH_nCE,nCSO))
FPGA_FLASH_DI: R141.1 U1.6(IO,_DIFFIO_L3n,_(DATA1,ASDO))
FPGA_FLASH_DO: R22.1 R143.1 U1.13(IO,_(DATA0))
FPGA_FLASH_WP: D33.3(~{WP}) R146.1
FPGA_I2S_DATA: D8.4(IN_1) U1.58(IO,_DIFFIO_B16p,_(DQ1B))
FPGA_I2S_LRCK: D8.5(IN_2) U1.59(IO,_DIFFIO_B17p,_(DQ1B))
FPGA_I2S_MCLK: D8.6(IN/OUT_3) U1.24(CLK2,_DIFFCLK_1p)
FPGA_I2S_WCK: D30.2(SDA_A) U1.60(IO,_DIFFIO_B17n,_(DQ1B))
FPGA_MSEL0: R135.2 R136.1 U1.94(MSEL0) U2.18(PB0)
FPGA_MSEL1: R133.2 R134.1 U1.96(MSEL1) U2.19(PB1)
FPGA_MSEL2: R131.2 R132.1 U1.97(MSEL2) U2.20(PB2/BOOT1)
FPGA_nCE: U1.21(nCE) U2.39(PB3/JTDO)
FPGA_nCONFIG: U1.14(nCONFIG) U2.42(PB6)
FPGA_nSTATUS: U1.9(nSTATUS) U2.43(PB7)
FPGA_SPI_CSN: D30.3(SCL_A) U1.76(IO,_RUP3) U2.31(PA10)
FPGA_SPI_MISO: P2.3 U1.20(TDO) U2.16(PA6)  [also labelled JTAG_TDO]
FPGA_SPI_MOSI: R22.2 R23.1 U2.17(PA7)
FPGA_SPI_NSS: P2.5 R137.1 U1.18(TMS) U2.14(PA4)  [also labelled JTAG_TMS]
FPGA_SPI_SCK: R86.1 R87.1 U2.15(PA5)
JTAG_TCK: P2.1 R86.2 R140.2 U1.16(TCK)
JTAG_TDI: P2.9 R23.2 R138.1 U1.15(TDI)
MCU_UART_RX: P3.2 U2.13(PA3)
MCU_UART_TX: P3.1 U2.12(PA2)
USB_5V0: C3.1 C4.1 D11.1(EN) D31.1(EN) L1.2 L9.2 L12.2 L24.2 X1.1
USB_CONN_DM: D1.1(IO1) J.2(D-)
USB_CONN_DP: D1.3(IO2) J.3(D+)
USB_CONN_SHIELD: J.S1(SHIELD) J.S2(SHIELD)
USB_DM: D4.4(USB_DM) R8.2
USB_DP: D4.5(USB_DP) R7.2
USB_PROT_DM: D1.6(IO4) R8.1
USB_PROT_DP: D1.4(IO3) R7.1
USB_VBUS: C1.1 D1.5(VCC) J.1(VCC) L1.1
NetC5_1: C5.1 C6.1 C7.1 D3.4(VCC) L2.1
NetC8_2: C8.2 D4.48(SPDIF_C_EXT)
NetC9_1: C9.1 C10.1 C11.1 D5.4(VCC) L3.1
NetC12_1: C12.1 D4.8(XTAL_IN_12M) X7.1
NetC13_2: C13.2 D4.9(XTAL_OUT) X7.2
NetC14_1: C14.1 C15.1 D6.5(VCC) L4.1
NetC28_2: C28.2 D8.1(VDDA) L5.2
NetC29_1: C29.1 D8.16(VDDB) L6.1
NetC31_1: C31.1 C32.2 C33.2 L7.2 L8.1 R30.1
NetC33_1: C33.1 D9.5(FB) R28.1 R30.2
NetC36_1: C36.1 C37.2 D9.4(IN) L9.1
NetC38_1: C38.1 C39.2 C40.2 L10.2 L11.1 R32.1
NetC40_1: C40.1 D11.5(FB) R31.1 R32.2
NetC43_1: C43.1 C44.2 D11.4(IN) L12.1
NetC190_1: C190.1 C191.2 C192.2 L22.2 L23.1 R5.1
NetC192_1: C192.1 D31.5(FB) R4.1 R5.2
NetC194_1: C194.1 C195.2 D31.4(IN) L24.1
NetC196_1: C196.1 C197.1 C198.1 D32.4(VCC) L25.1 R90.2
NetC200_1: C200.1 U2.5(OSC_IN/PD0) X17.1
NetC201_2: C201.2 R147.1 X17.2
NetD3_3: D3.3(OUT) R9.1
NetD4_1: D4.1(USB_R) R10.2
NetD4_27: D4.27(I2S_DAC_LRCK_DSD_L) R13.2
NetD4_28: D4.28(I2S_DAC_DATA_DSD_R) R14.2
NetD4_29: D4.29(I2S_DAC_SCK) R15.2
NetD4_30: D4.30(I2S_DAC_MCLK) R16.2
NetD5_3: D5.3(OUT) R12.1
NetD6_4: D6.4(OUT) R17.1
NetD7_7: D7.7(~{RES}) R18.2
NetD8_11: D8.11(IN/OUT_3) R24.2
NetD8_12: D8.12(OUT_2) R25.2
NetD8_13: D8.13(OUT1) R26.2
NetD8_14: D8.14(OUT_0) R27.2
NetD9_3: D9.3(LX) L8.2
NetD11_3: D11.3(LX) L11.2
NetD31_3: D31.3(LX) L23.2
NetD32_1: D32.1(EN) R88.2 R90.1
NetD32_3: D32.3(OUT) R100.1
NetD33_1: D33.1(~{C}S) R145.2
NetD33_2: D33.2(DO) R143.2
NetD33_5: D33.5(DI) R141.2
NetD33_6: D33.6(CLK) R144.2
NetD33_7: D33.7(~{RES}) R142.2
NetP1_1: P1.1 U2.7(NRST)
NetP1_2: P1.2 U2.34(PA13/JTMS/SWDIO)
NetP1_6: P1.6 U2.37(PA14/JTCK/SWCLK)
NetP2_6: P2.6 R139.1
NetR125_2: R125.2 R126.1 U2.44(BOOT0)
NetR127_2: R127.2 R128.1 U3.3(DQ2/WP#)
NetR129_2: R129.2 R130.1 U3.7(DQ3/HOLD#)
NetR147_2: R147.2 U2.6(OSC_OUT/PD1)

Not connected (* = marked no-connect by the designer): D4 16(I2C_MASTER_SCK_GPIOA4)* 19(I2S_ADC_SCK)* 20(I2S_ADC_DATA_DSD_R)* 21(I2S_ADC_LRCK_DSD_L)* 22(I2S_ADC_MCLK)* 36(UART_RX_GPIO_A7) 43(SPDIF_OUT)* 47(SPDIF_IN)*; D8 7(VE1)* 10(VE2)*; P1 5 7 8 9 10; P2 7* 8*; U1 7(IO,_VREFB1N0)* 10(IO,_DIFFIO_L6p,_(DQS0L/CQ1L,DPCLK0))* 11(IO,_DIFFIO_L6n)* 25(CLK3,_DIFFCLK_1n)* 28(IO,_DIFFIO_L8p)* 30(IO,_DIFFIO_L11p,_(DQS1L/CQ1L#,DPCLK1))* 31(IO,_VREFB2N0)* 32(IO,_RUP1)* 33(IO,_RDN1)* 39(IO,_DIFFIO_B2p)* 42(IO,_(DQS1B/CQ1B#,CDPCLK2))* 43(IO,_PLL1_CLKOUTp)* 44(IO,_PLL1_CLKOUTn)* 46(IO,_VREFB3N0)* 49(IO,_DIFFIO_B9n,_(DQ1B))* 50(IO,_DIFFIO_B10n,_(DQ1B))* 51(IO,_DIFFIO_B11p,_(DQ1B))* 52(CLK15,_DIFFCLK_6p)* 53(CLK14,_DIFFCLK_6n)* 54(CLK13,_DIFFCLK_7p)* 55(CLK12,_DIFFCLK_7n)* 83(IO,_DIFFIO_R11p)* 85(IO,_DIFFIO_R10p,_(DQS1R/CQ1R#,DPCLK6))* 86(IO,_DIFFIO_R9n,_(DEV_OE))* 87(IO,_DIFFIO_R9p,_(DEV_CLRn))* 88(CLK7,_DIFFCLK_3n)* 89(CLK6,_DIFFCLK_3p)* 90(CLK5,_DIFFCLK_2n)* 91(CLK4,_DIFFCLK_2p)* 98(IO,_DIFFIO_R5n,_(INIT_DONE))* 99(IO,_DIFFIO_R5p,_(CRC_ERROR))* 100(IO)* 101(IO,_DIFFIO_R4n,_(nCEO))* 103(IO,_DIFFIO_R4p,_(CLKUSR))* 104(IO,_(DQS0R/CQ1R,DPCLK7))* 105(IO,_VREFB6N0)* 106(IO,_DIFFIO_R1n,_(PADD20))* 110(IO,_DIFFIO_T23p,_(DQS0T/CQ1T,CDPCLK6))* 111(IO,_DIFFIO_T22p)* 112(IO,_PLL2_CLKOUTn)* 113(IO,_PLL2_CLKOUTp)* 114(IO,_RUP4,_(DQ1T))* 115(IO,_RDN4,_(DQ1T))* 119(IO,_VREFB7N0)* 120(IO,_DIFFIO_T19n,_(PADD1),_(DQ1T))* 121(IO,_DIFFIO_T17p,_(PADD4))* 125(IO,_DIFFIO_T13p,_(PADD12))* 126(CLK8,_DIFFCLK_5n)* 127(CLK9,_DIFFCLK_5p)* 128(CLK10,_DIFFCLK_4n)* 129(CLK11,_DIFFCLK_4p)* 132(IO,_DIFFIO_T10n,_(DATA2),_(DQ1T))* 133(IO,_DIFFIO_T10p,_(DATA3),_(DQ1T))* 135(IO,_DIFFIO_T9p,_(DATA4),_(DQ1T))* 136(IO,_VREFB8N0)* 137(IO,_(DATA5),_(DQ1T))* 141(IO,_DIFFIO_T2p)* 142(IO,_(DATA12),_(DQS1T/CQ1T#,CDPCLK7))* 143(IO,_PLL3_CLKOUTn,_(DQ1T))* 144(IO,_PLL3_CLKOUTp,_(DM1T))*; U2 3(PC14-OSC32_IN)* 4(PC15-OSC32_OUT)* 10(PA0-WKUP)* 11(PA1)* 32(PA11)* 33(PA12)* 38(PA15/JTDI)*

### Notes on the sheet
- Labels drawn without touching a wire or pin: CPU_I2C_DATA, CPU_I2C_SCK
- Перв. примен.
- Справ. №
- Подп. дата
- Инв. № дубл.
- Взам. инв. №
- Подп. и дата
- Изм.
- Разраб.
- Лист
- № докум.
- Подп.
- Дата
- Лит.
- Масса
- Масштаб
- Пров.
- Т.контр.
- Листов
- Инв. № подл.
- Н.контр.
- Утв.
- ALTIUM GOSTBOM2.0 KEV
- Файл:
- Копировал
- Формат А0
- (in symbol ADUM1250) ISO
- (in symbol EEEFK1A102AP) +
- (in symbol EP4CE22E22C6, part A) BANK 1
- (in symbol EP4CE22E22C6, part B) BANK 2
- (in symbol EP4CE22E22C6, part C) BANK 3
- (in symbol EP4CE22E22C6, part D) BANK 4
- (in symbol EP4CE22E22C6, part E) BANK 5
- (in symbol EP4CE22E22C6, part F) BANK 6
- (in symbol EP4CE22E22C6, part G) BANK 7
- (in symbol EP4CE22E22C6, part H) BANK 8
- (in symbol SN74LVC1G14DBVR) T
- (in symbol TANT_B) +
- (in symbol USBLC6-4SC6) *V
- (in symbol W25Q32JVSS) ROM